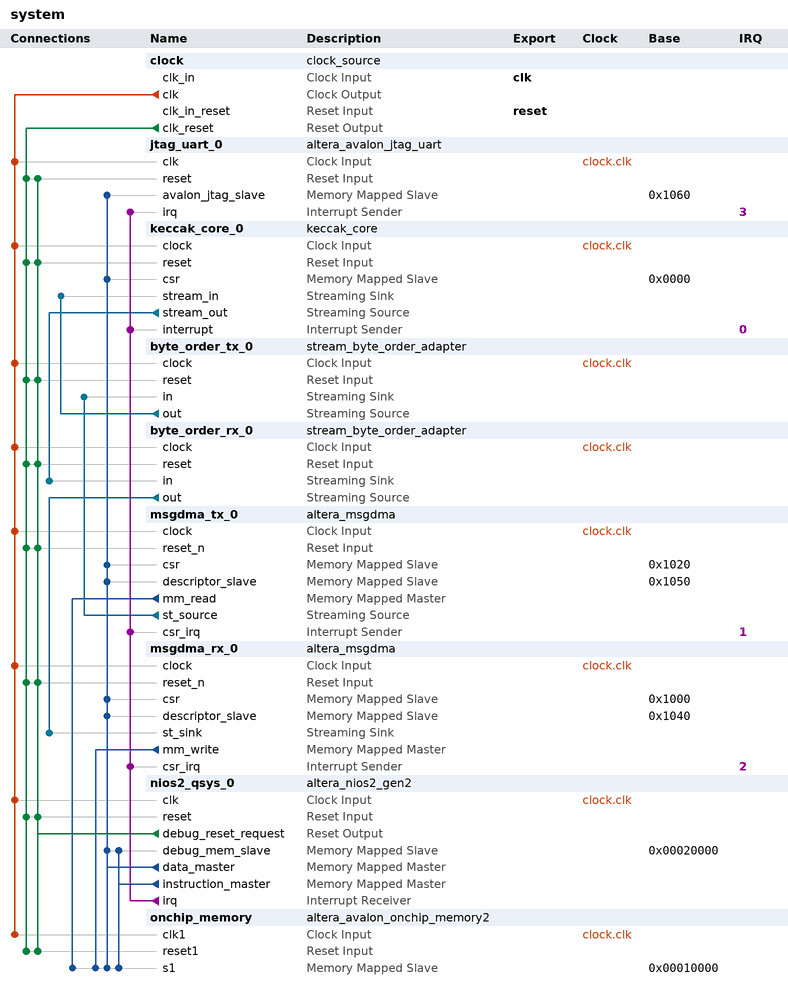
[diagram p0: system contents]
# Platform Designer (Qsys) system system, Cyclone V 5CSEMA5F31C6
# Parameters at their usual value, and those the tool derives, are not listed.
package require -exact qsys 23.1
create_system system
set_project_property DEVICE_FAMILY {Cyclone V}
set_project_property DEVICE 5CSEMA5F31C6

add_instance clock clock_source 23.1
set_instance_parameter_value clock clockFrequency 50000000

add_instance jtag_uart_0 altera_avalon_jtag_uart 23.1
set_instance_parameter_value jtag_uart_0 simInteractiveOptions NO_INTERACTIVE_WINDOWS

add_instance keccak_core_0 keccak_core 1.0
set_instance_parameter_value keccak_core_0 AXIS_DATA_WIDTH 64

add_instance byte_order_tx_0 stream_byte_order_adapter 1.0
set_instance_parameter_value byte_order_tx_0 DATA_WIDTH 64
set_instance_parameter_value byte_order_tx_0 INPUT_HIGH_FIRST true

add_instance byte_order_rx_0 stream_byte_order_adapter 1.0
set_instance_parameter_value byte_order_rx_0 DATA_WIDTH 64
set_instance_parameter_value byte_order_rx_0 INPUT_HIGH_FIRST false

add_instance msgdma_tx_0 altera_msgdma 23.1
set_instance_parameter_value msgdma_tx_0 BURST_ENABLE 1
set_instance_parameter_value msgdma_tx_0 DATA_FIFO_DEPTH 64
set_instance_parameter_value msgdma_tx_0 DATA_WIDTH 64
set_instance_parameter_value msgdma_tx_0 DESCRIPTOR_FIFO_DEPTH 128
set_instance_parameter_value msgdma_tx_0 ENHANCED_FEATURES 0
set_instance_parameter_value msgdma_tx_0 ERROR_ENABLE 0
set_instance_parameter_value msgdma_tx_0 MAX_BURST_COUNT 16
set_instance_parameter_value msgdma_tx_0 MAX_BYTE 67108864
set_instance_parameter_value msgdma_tx_0 MODE 1
set_instance_parameter_value msgdma_tx_0 PACKET_ENABLE 1
set_instance_parameter_value msgdma_tx_0 TRANSFER_TYPE {Unaligned Accesses}

add_instance msgdma_rx_0 altera_msgdma 23.1
set_instance_parameter_value msgdma_rx_0 BURST_ENABLE 1
set_instance_parameter_value msgdma_rx_0 DATA_FIFO_DEPTH 64
set_instance_parameter_value msgdma_rx_0 DATA_WIDTH 64
set_instance_parameter_value msgdma_rx_0 DESCRIPTOR_FIFO_DEPTH 128
set_instance_parameter_value msgdma_rx_0 ENHANCED_FEATURES 0
set_instance_parameter_value msgdma_rx_0 ERROR_ENABLE 0
set_instance_parameter_value msgdma_rx_0 MAX_BURST_COUNT 16
set_instance_parameter_value msgdma_rx_0 MAX_BYTE 67108864
set_instance_parameter_value msgdma_rx_0 MODE 2
set_instance_parameter_value msgdma_rx_0 PACKET_ENABLE 1
set_instance_parameter_value msgdma_rx_0 TRANSFER_TYPE {Unaligned Accesses}

add_instance nios2_qsys_0 altera_nios2_gen2 23.1
set_instance_parameter_value nios2_qsys_0 impl Tiny
set_instance_parameter_value nios2_qsys_0 resetSlave onchip_memory.s1
set_instance_parameter_value nios2_qsys_0 exceptionSlave onchip_memory.s1
set_instance_parameter_value nios2_qsys_0 icache_size 0
set_instance_parameter_value nios2_qsys_0 dcache_size 0

add_instance onchip_memory altera_avalon_onchip_memory2 23.1
set_instance_parameter_value onchip_memory dataWidth 32
set_instance_parameter_value onchip_memory dualPort false
set_instance_parameter_value onchip_memory initMemContent false
set_instance_parameter_value onchip_memory initializationFileName onchip_mem.hex
set_instance_parameter_value onchip_memory memorySize 65536

# connections
add_connection clock.clk byte_order_rx_0.clock clock
add_connection clock.clk byte_order_tx_0.clock clock
add_connection clock.clk jtag_uart_0.clk clock
add_connection clock.clk keccak_core_0.clock clock
add_connection clock.clk msgdma_rx_0.clock clock
add_connection clock.clk msgdma_tx_0.clock clock
add_connection clock.clk nios2_qsys_0.clk clock
add_connection clock.clk onchip_memory.clk1 clock
add_connection clock.clk_reset byte_order_rx_0.reset reset
add_connection clock.clk_reset byte_order_tx_0.reset reset
add_connection clock.clk_reset jtag_uart_0.reset reset
add_connection clock.clk_reset keccak_core_0.reset reset
add_connection clock.clk_reset msgdma_rx_0.reset_n reset
add_connection clock.clk_reset msgdma_tx_0.reset_n reset
add_connection clock.clk_reset nios2_qsys_0.reset reset
add_connection clock.clk_reset onchip_memory.reset1 reset
add_connection nios2_qsys_0.debug_reset_request byte_order_rx_0.reset reset
add_connection nios2_qsys_0.debug_reset_request byte_order_tx_0.reset reset
add_connection nios2_qsys_0.debug_reset_request jtag_uart_0.reset reset
add_connection nios2_qsys_0.debug_reset_request keccak_core_0.reset reset
add_connection nios2_qsys_0.debug_reset_request msgdma_rx_0.reset_n reset
add_connection nios2_qsys_0.debug_reset_request msgdma_tx_0.reset_n reset
add_connection nios2_qsys_0.debug_reset_request nios2_qsys_0.reset reset
add_connection nios2_qsys_0.debug_reset_request onchip_memory.reset1 reset
add_connection msgdma_rx_0.mm_write onchip_memory.s1 avalon
set_connection_parameter_value msgdma_rx_0.mm_write/onchip_memory.s1 baseAddress 0x00010000
add_connection msgdma_tx_0.mm_read onchip_memory.s1 avalon
set_connection_parameter_value msgdma_tx_0.mm_read/onchip_memory.s1 baseAddress 0x00010000
add_connection nios2_qsys_0.data_master jtag_uart_0.avalon_jtag_slave avalon
set_connection_parameter_value nios2_qsys_0.data_master/jtag_uart_0.avalon_jtag_slave baseAddress 0x1060
add_connection nios2_qsys_0.data_master keccak_core_0.csr avalon
set_connection_parameter_value nios2_qsys_0.data_master/keccak_core_0.csr baseAddress 0x0000
add_connection nios2_qsys_0.data_master msgdma_rx_0.csr avalon
set_connection_parameter_value nios2_qsys_0.data_master/msgdma_rx_0.csr baseAddress 0x1000
add_connection nios2_qsys_0.data_master msgdma_rx_0.descriptor_slave avalon
set_connection_parameter_value nios2_qsys_0.data_master/msgdma_rx_0.descriptor_slave baseAddress 0x1040
add_connection nios2_qsys_0.data_master msgdma_tx_0.csr avalon
set_connection_parameter_value nios2_qsys_0.data_master/msgdma_tx_0.csr baseAddress 0x1020
add_connection nios2_qsys_0.data_master msgdma_tx_0.descriptor_slave avalon
set_connection_parameter_value nios2_qsys_0.data_master/msgdma_tx_0.descriptor_slave baseAddress 0x1050
add_connection nios2_qsys_0.data_master nios2_qsys_0.debug_mem_slave avalon
set_connection_parameter_value nios2_qsys_0.data_master/nios2_qsys_0.debug_mem_slave baseAddress 0x00020000
add_connection nios2_qsys_0.data_master onchip_memory.s1 avalon
set_connection_parameter_value nios2_qsys_0.data_master/onchip_memory.s1 baseAddress 0x00010000
add_connection nios2_qsys_0.instruction_master nios2_qsys_0.debug_mem_slave avalon
set_connection_parameter_value nios2_qsys_0.instruction_master/nios2_qsys_0.debug_mem_slave baseAddress 0x00020000
add_connection nios2_qsys_0.instruction_master onchip_memory.s1 avalon
set_connection_parameter_value nios2_qsys_0.instruction_master/onchip_memory.s1 baseAddress 0x00010000
add_connection byte_order_rx_0.out msgdma_rx_0.st_sink avalon_streaming
add_connection byte_order_tx_0.out keccak_core_0.stream_in avalon_streaming
add_connection keccak_core_0.stream_out byte_order_rx_0.in avalon_streaming
add_connection msgdma_tx_0.st_source byte_order_tx_0.in avalon_streaming
add_connection nios2_qsys_0.irq jtag_uart_0.irq interrupt
set_connection_parameter_value nios2_qsys_0.irq/jtag_uart_0.irq irqNumber 3
add_connection nios2_qsys_0.irq keccak_core_0.interrupt interrupt
set_connection_parameter_value nios2_qsys_0.irq/keccak_core_0.interrupt irqNumber 0
add_connection nios2_qsys_0.irq msgdma_rx_0.csr_irq interrupt
set_connection_parameter_value nios2_qsys_0.irq/msgdma_rx_0.csr_irq irqNumber 2
add_connection nios2_qsys_0.irq msgdma_tx_0.csr_irq interrupt
set_connection_parameter_value nios2_qsys_0.irq/msgdma_tx_0.csr_irq irqNumber 1

# exported interfaces
add_interface clk clock sink
set_interface_property clk EXPORT_OF clock.clk_in
add_interface reset reset sink
set_interface_property reset EXPORT_OF clock.clk_in_reset

set_interconnect_requirement {$system} qsys_mm.clockCrossingAdapter HANDSHAKE
set_interconnect_requirement {$system} qsys_mm.maxAdditionalLatency 1

save_system system.qsys
